# EAGLE design AFT05MS004N_70 (EAGLE 7.7.0)
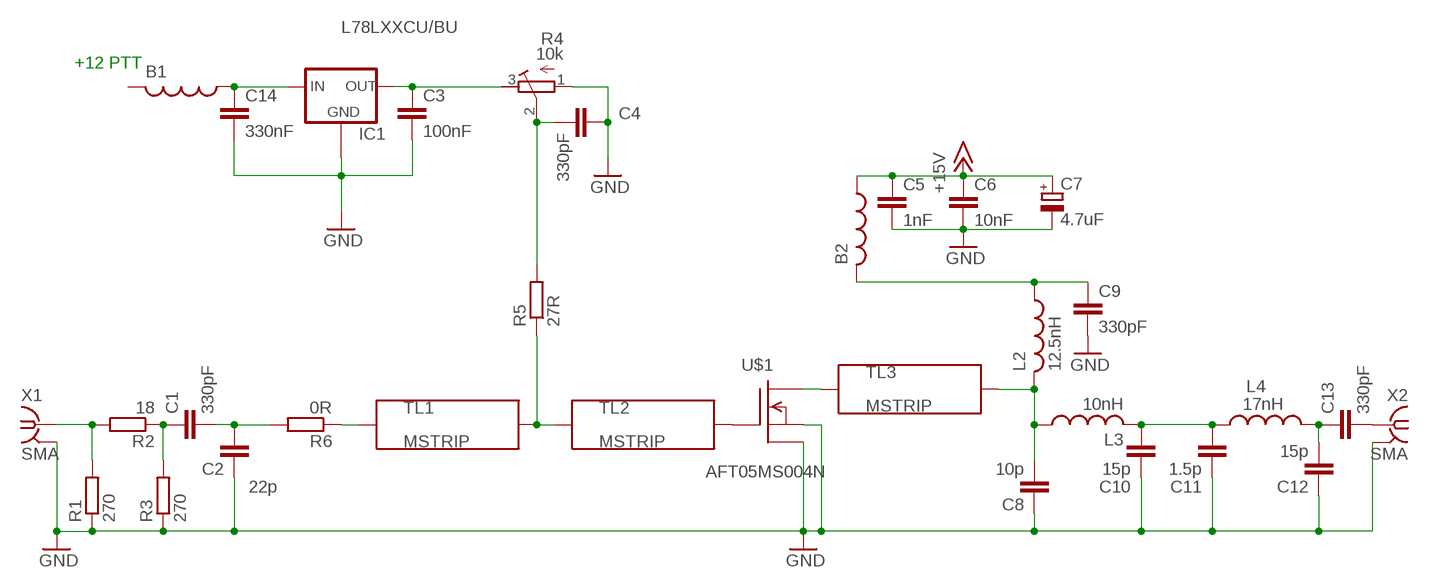
[diagram p0: schematic, sheet 1]

## Parts
B1  L-US0204/5  [0204/5]
B2  L-US0204/5  [0204/5]
C1  330pF  C-EUC0805  [C0805]
C2  22p  C-EUC0603  [C0603]
C3  100nF  C-EUC0805  [C0805]
C4  330pF  C-EUC0603  [C0603]
C5  1nF  C-EUC0603  [C0603]
C6  10nF  C-EUC0805  [C0805]
C7  4.7uF  CPOL-EUSANYO_SMD_B6  [SANYO-OSCON_SMD_B6]
C8  10p  C-EUC0603  [C0603]
C9  330pF  C-EUC0603  [C0603]
C10  15p  C-EUC0603  [C0603]
C11  1.5p  C-EUC0603  [C0603]
C12  15p  C-EUC0603  [C0603]
C13  330pF  C-EUC0805  [C0805]
C14  330nF  C-EUC0805  [C0805]
IC1  L78LXXCU/BU  [SOT89]
L2  12.5nH  L_0805  [0805]
L3  10nH  L_0805  [0805]
L4  17nH  L_0805  [0805]
R1  270  R-EU_R0603  [R0603]
R2  18  R-EU_R0603  [R0603]
R3  270  R-EU_R0603  [R0603]
R4  10k  R-TRIMM3214W  [RTRIM3214W]
R5  27R  R-EU_R0603  [R0603]
R6  0R  R-EU_R0603  [R0603]
TL1  MSTRIP  [TRLINE2]
TL2  MSTRIP  [TRLINE2]
TL3  MSTRIP  [TRLINE2]
U$1  AFT05MS004N  PD84004  [SOT-89]
X1  SMA  SMA-142-0711-871/876  [J502-ND-142-0711-871/876]
X2  SMA  SMA-142-0711-871/876  [J502-ND-142-0711-871/876]

## Nets
+13.6: B2.1 C5.1 C6.1 C7.+ ; supply symbol labelled +15V
GND: C2.1 C3.2 C4.1 C5.2 C6.2 C7.- C8.1 C9.2 C10.1 C11.1 C12.1 C14.2 IC1.4(GND1) R1.1 R3.1 R4.1(E) U$1.2(S) U$1.2@1(S1) X1.G@1(GND) X2.G@1(GND)
N$1: R1.2 R2.2 X1.1
N$2: B2.2 C9.1 L2.1
N$3: C13.2 X2.1
N$4: R6.1 TL1.P$1
N$5: C4.2 R4.2(S) R5.2
N$6: C8.2 L2.2 L3.1 TL3.P$2
N$7: B1.1 C14.1 IC1.3(IN)
N$8: C1.2 C2.2 R6.2
N$9: C3.1 IC1.1(OUT) R4.3(A)
N$10: C10.2 C11.2 L3.2 L4.1
N$11: C12.2 C13.1 L4.2
N$12: C1.1 R2.1 R3.2
N$13: TL2.P$2 U$1.1(G)
N$14: R5.1 TL1.P$2 TL2.P$1
N$21: TL3.P$1 U$1.3(D)
Unconnected: B1.2 IC1.2(GND)

## Notes on the sheet
- +12 PTT

## Power pins joined to a net without a drawn wire
GND: X1.G@2(GND) X1.G@3(GND) X1.G@4(GND) X2.G@2(GND) X2.G@3(GND) X2.G@4(GND)

## Library data of the parts
B1 B2 = rcl:L-US: INDUCTOR, American symbol
C1-C6 C8-C14 = rcl:C-EU: CAPACITOR, European symbol
C7 = rcl:CPOL-EU: POLARIZED CAPACITOR, European symbol
IC1 = v-reg-2:L78LXXCU/BU: VOLTAGE REGULATOR
L2-L4 = g4bao:L_0805
R1-R3 R5 R6 = rcl:R-EU_: RESISTOR, European symbol
R4 = rcl:R-TRIMM: Trimm resistor
TL1-TL3 = g4bao1:MSTRIP
U$1 = g4bao1:PD84004
X1 X2 = con-coax:SMA-: SMA 50 Ohm End Launch Jack Receptacle - Round Contact Johnson Components Source: www.johnsoncomponents.com .. J502-ND.pdf

## Board
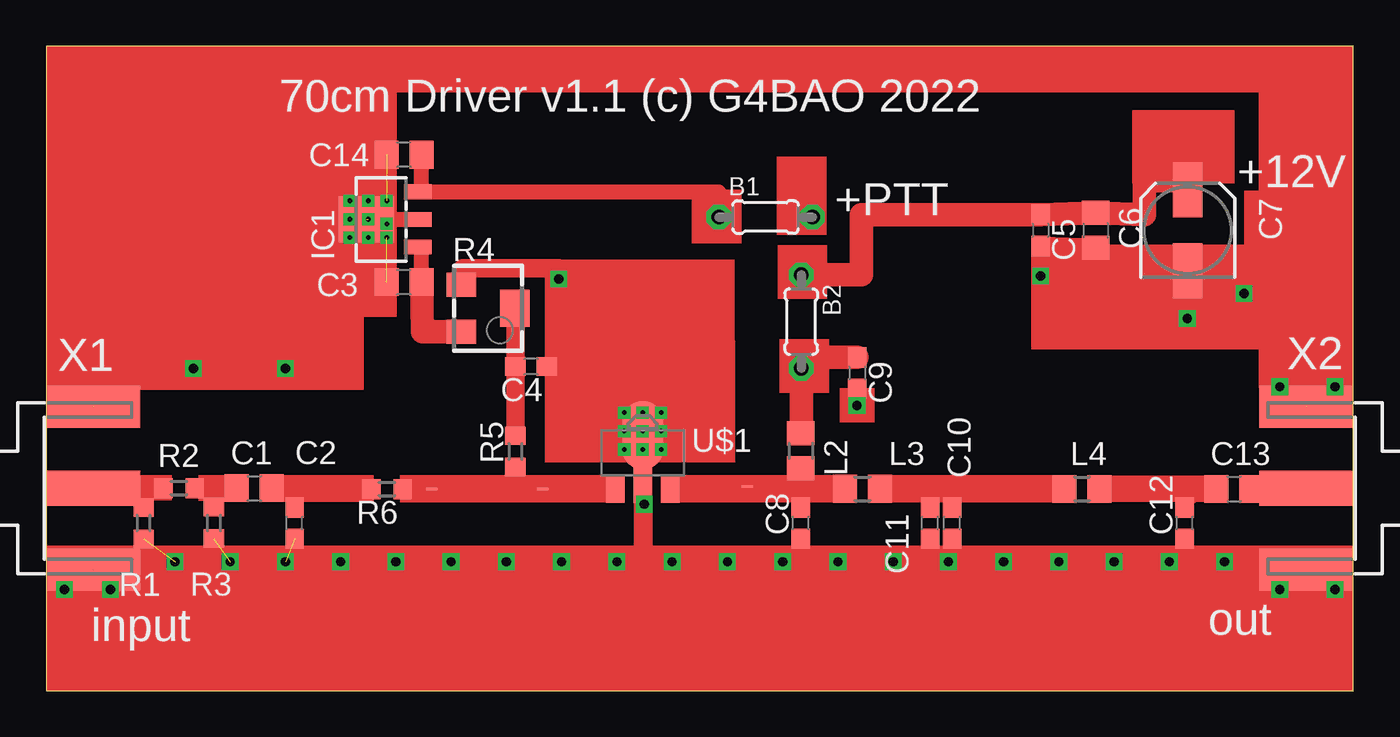
[diagram p1: board, top side]
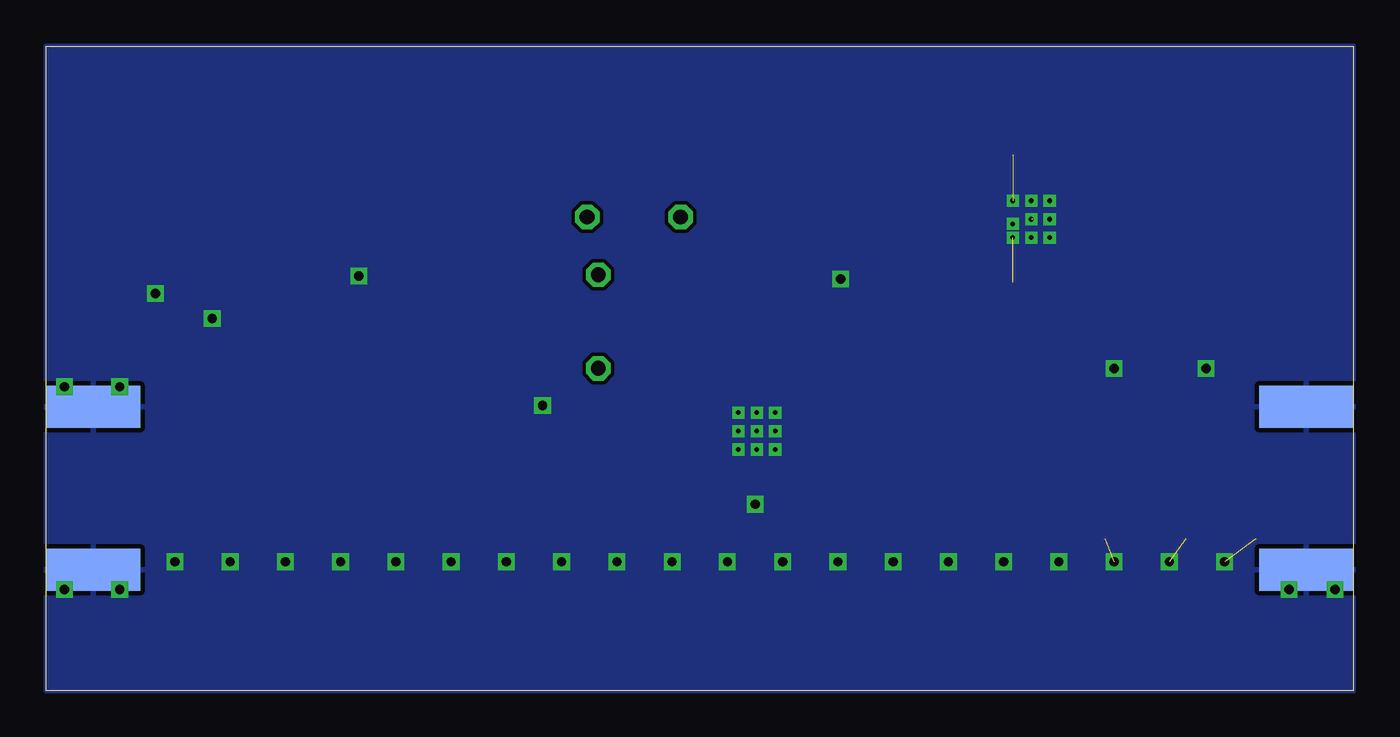
[diagram p2: board, bottom side, seen from below]

Size 71 x 35 mm. Coordinates in mm from the lower left corner, seen from the top.
Outline: 0,0 71,0 71,35 0,35 0,0
Copper layers (1*16): Top 0.035mm / dielectric 1.5mm / Bottom 0.035mm
Design rules "default *": minimum track width 10mil, minimum drill 0.25mm, track to track 8mil, track to pad 8mil, pad to pad 8mil, via to via 8mil, smd to smd 8mil, copper to edge 0mil, drill to drill 8mil, minimum pad ring 10mil, minimum via ring 8mil, stop-mask expansion 4mil, vias tented up to drill 0mil, thermal gap 10mil

### Footprints (pad centres in the part's own frame; a part is rotated, then mirrored left to right if it is on the bottom)
0204/5 = drill 0.813 octagon: 1 -2.54,0; 2 2.54,0
C0805 = smd 1.3 x 1.5: 1 -0.95,0; 2 0.95,0
C0603 = smd 1.1 x 1: 1 -0.85,0; 2 0.85,0
SANYO-OSCON_SMD_B6 = smd 3 x 1.6: + 2.2,0; - -2.2,0
SOT89 = smd 0.8 x 1.5: 1 -1.5,-1.75; 2 0,-1.75; 3 1.5,-1.75 | smd 2.5 x 3: 4 0,1.05
0805 = smd 1.3 x 1.5: 1 -2.22,1.27; 2 -0.32,1.27
R0603 = smd 1 x 1.1: 1 -0.85,0; 2 0.85,0
RTRIM3214W = smd 1.3 x 1.6: 1 -1.275,-1.45; 3 1.275,-1.45 | smd 2 x 1.6: 2 0,1.45
TRLINE2 = smd 0.305 x 0.152: P$1 -3.139,1.555; P$2 -2.813,1.554
SOT-89 = smd 1 x 1.5: 1 -1.499,-1.981; 3 1.499,-1.981 | smd 1 x 2: 2 0,-1.727 | smd 2.2 x 3.7: 2@1 0,0.94
J502-ND-142-0711-871/876 = smd 5.08 x 1.905: 1 2.565,0 | smd 5.08 x 2.286: G@1 2.565,4.42; G@2 2.565,-4.42 | smd 5.08 x 2.286 bottom: G@3 2.565,4.42; G@4 2.565,-4.42

### Placement (x,y rotation side)
B1  39.07,25.72 0 top
B2  41.01,20.04 270 top
C1  11.3,11 0 top
C2  13.5,9.1 90 top
C3  19.44,22.18 180 top
C4  26.34,17.61 180 top
C5  54,25 270 top
C6  57,25 270 top
C7  62,25 90 top
C8  40.99,9.1 90 top
C9  44.05,17.25 270 top
C10  49.2,9.1 90 top
C11  48.01,9.1 90 top
C12  61.83,9.1 90 top
C13  64.51,10.96 0 top
C14  19.44,29.1 180 top
IC1  18.45,25.59 90 top
L2  39.72,11.76 270 top
L3  45.61,9.69 0 top
L4  57.53,9.69 0 top
R1  5.3,9.1 90 top
R2  7.22,11 180 top
R3  9.12,9.12 90 top
R4  24,20.77 270 top
R5  25.49,13 90 top
R6  18.51,10.95 180 top
TL1  23.93,9.4 0 top
TL2  29.96,9.4 0 top
TL3  41.06,9.54 0 top
U$1  32.4,12.93 0 top
X1  0,11 0 top
X2  71,11 180 top

### Tracks (layer width: path | path; a pad name or v marks a point on that pad's centre or on a via)
+13.6
  Top 1.016: C5.1 | 59.66,27.54 62,27.54 C7.+
  Top 1.27: B2.1 44.27,22.58 44.27,25.84 C5.1 | C5.1 C6.1 59.66,25.85 59.66,27.54
GND  (via drill 0.25, 0.5, 0.5 pad 0.81)  (9 unrouted)
  Top 0.406: 15.07,7.03 v16,7 16.81,7 | v40,7 40.99,7 C8.1 | C10.1 49.2,7.06 v49,7 49,7.06 47.97,7.06 47.97,8.15 C11.1 | v70,16.5 68.41,16.45 | 68.41,16.45 v67,16.5 | v67,5.5 68.39,5.55 68.39,5.97 | X2.G@1 64.36,6.56 v64,7 | X2.G@4 68.41,15.4 68.41,16.45 | 2.56,6.59 3.02,6.56 v3.5,5.5 | 2.56,6.59 1.08,6.56 v1,5.5 | 2.56,6.59 2.63,6.56 2.63,6.87 2.68,6.87 2.68,6.85 6.91,6.85 v7,7 | 12.38,7.01 12.86,6.96 v13,7 | C4.1 27.84,17.61 v27.84,22.35 | 32.4,17.61 27.89,17.61 27.89,17.52 27.8,17.52 27.8,17.69 27.76,17.69
  Top 0.61: C12.1 61.9,8.44 61.9,7.04 61.36,7.04 v61,7 | R4.1 22.61,22.05 22.61,22.93 | 27.84,22.93 v27.84,22.35
  Top 0.813: C9.2 44.08,16.22 v44.04,15.49 | C10.1 49.16,8.15 | U$1.2 32.43,8.16 v32.48,10.12 | 16.81,7 16.81,6.1 | C8.1 41.06,8.11 | X2.G@4 68.41,15.47 | 68.4,6.8 68.2,6.8 68.2,6.6 68.36,6.6 X2.G@1 68.39,5.97 68.36,5.55 v70,5.5 | X2.G@4 67.37,15.4 67.37,15.12 68.43,15.12 X2.G@4 | X2.G@4 70.01,15.42 v70,16.5 | X2.G@4 68.31,15.42 68.31,20.19 61.97,20.19 61.97,20.27 | U$1.2@1 v32.4,14.1
  Top 1.016: C4.1 32.4,17.61 v32.4,15.1 | v54.01,22.51 54.01,24.15 C5.2 C6.2 | C7.- 61.98,22.8 v61.98,20.21 | 22.61,22.93 27.84,22.93
  other vias: 46,7 58,7 10,7 19,7 31,7 34,7 37,7 43,7 52,7 55,7 8,17.5 13,17.5 65.06,21.57 25,7 22,7 31.4,15.1 33.4,15.1 33.4,14.1 31.4,13.1 32.4,13.1 33.4,13.1 31.4,14.1 28,7 16.5,25.6 16.5,26.6 17.5,26.6 18.5,26.6 16.5,24.6 17.5,24.6 18.5,24.6 17.5,25.6 18.5,25.35
  pour Bottom: 0,35 71,35 71,0 0,0
N$1
  Top 0.406: X1.1 5.3,11 R1.2 5.25,9.95 5.25,11 R2.2
N$2
  Top 0.813: L2.1 41.01,14.13 | B2.2 41.01,18.1
  Top 1.27: 41.01,14.13 B2.2 | 41.01,18.1 C9.1
N$3
  Top 0.406: X2.1 65.29,10.98 C13.2
N$4
  Top 0.406: R6.1 TL1.P$1
N$5
  Top 1.016: R5.2 25.49,14.23 C4.2 25.49,20.77 R4.2
N$6
  Top 0.61: L3.1 41.02,11.13 40.99,11.13 L2.2 | L2.2 C8.2 | TL3.P$2 40.99,11.09 L2.2
N$7
  Top 0.406: IC1.3 20.39,27.09
  Top 0.813: 20.39,27.09 C14.1 | IC1.3 36.53,27.09 B1.1
N$8
  Top 0.406: C1.2 13.5,11 | 13.5,11 C2.2 | 13.5,11 17.66,11 R6.2
N$9
  Top 0.406: C3.1 20.2,22.16
  Top 0.813: IC1.1 20.39,24.09 C3.1
  Top 1.27: R4.3 20.44,19.5 C3.1
N$10
  Top 0.406: 54.99,11.01 49.2,11.01 C10.2 49.23,9.95 49.23,11 48.01,11 | 48.01,11 | 48.01,11 C11.2 48.01,11 | 48.01,11 45.34,11 L3.2
  Top 0.61: C10.2 49.21,9.85 | 54.99,11.01 L4.1
N$11
  Top 0.61: C13.1 61.83,11 C12.2 61.86,10.14 62.9,10.96 | L4.2 57.78,10.96
  Top 1.436: 57.78,10.96 62.9,10.96
N$12
  Top 0.406: R3.2 9.12,11 R2.1 C1.1
N$13
  Top 0.406: U$1.1 TL2.P$2
N$14
  Top 0.406: TL1.P$2 21.11,10.99 25.3,10.99 25.3,12.15 R5.1 25.49,10.84 26.87,10.84 26.87,10.95 TL2.P$1
N$21
  Top 0.61: U$1.3 42.66,10.99 42.66,11.13 37.92,11.13 TL3.P$1
(copper drawn outside any net)
  shapes: Top area x28

### Text on the board
tNames: 70cm Driver v1.1 (c) G4BAO 2022 | +12V | +PTT | input | out